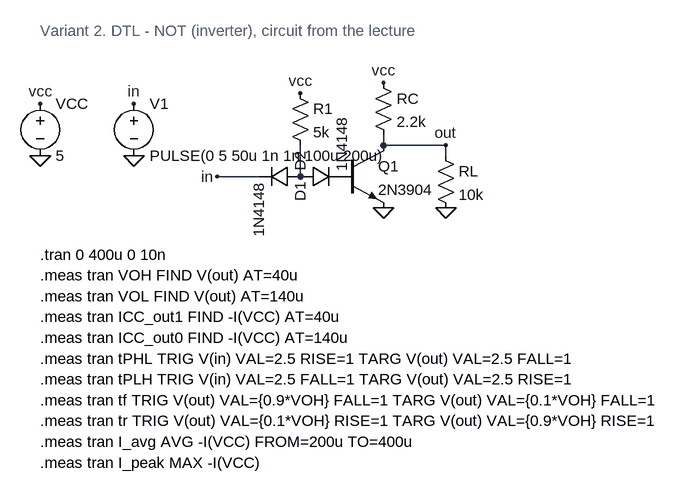
[diagram p0: schematic 1_DTL_NOT (1).asc]
1_DTL_NOT (1).asc, the LTspice schematic file:
Version 4
SHEET 1 1200 680
SYMBOL voltage -176 32 R0
SYMATTR InstName VCC
SYMATTR Value 5
FLAG -176 48 vcc
FLAG -176 128 0
SYMBOL voltage -32 32 R0
SYMATTR InstName V1
SYMATTR Value PULSE(0 5 50u 1n 1n 100u 200u)
FLAG -32 48 in
FLAG -32 128 0
SYMBOL res 208 16 R0
SYMATTR InstName R1
SYMATTR Value 5k
FLAG 224 32 vcc
WIRE 224 112 224 160
SYMBOL diode 224 144 R90
SYMATTR InstName D1
SYMATTR Value 1N4148
WIRE 160 160 96 160
FLAG 96 160 in
SYMBOL diode 224 176 R270
SYMATTR InstName D2
SYMATTR Value 1N4148
SYMBOL npn 288 112 R0
SYMATTR InstName Q1
SYMATTR Value 2N3904
FLAG 352 208 0
SYMBOL res 336 0 R0
SYMATTR InstName RC
SYMATTR Value 2.2k
FLAG 352 16 vcc
WIRE 352 96 352 112
WIRE 352 112 448 112
FLAG 448 112 out
SYMBOL res 432 112 R0
SYMATTR InstName RL
SYMATTR Value 10k
WIRE 448 112 448 128
FLAG 448 208 0
TEXT -176 280 Left 2 !.tran 0 400u 0 10n
TEXT -176 312 Left 2 !.meas tran VOH FIND V(out) AT=40u
TEXT -176 344 Left 2 !.meas tran VOL FIND V(out) AT=140u
TEXT -176 376 Left 2 !.meas tran ICC_out1 FIND -I(VCC) AT=40u
TEXT -176 408 Left 2 !.meas tran ICC_out0 FIND -I(VCC) AT=140u
TEXT -176 440 Left 2 !.meas tran tPHL TRIG V(in) VAL=2.5 RISE=1 TARG V(out) VAL=2.5 FALL=1
TEXT -176 472 Left 2 !.meas tran tPLH TRIG V(in) VAL=2.5 FALL=1 TARG V(out) VAL=2.5 RISE=1
TEXT -176 504 Left 2 !.meas tran tf TRIG V(out) VAL={0.9*VOH} FALL=1 TARG V(out) VAL={0.1*VOH} FALL=1
TEXT -176 536 Left 2 !.meas tran tr TRIG V(out) VAL={0.1*VOH} RISE=1 TARG V(out) VAL={0.9*VOH} RISE=1
TEXT -176 568 Left 2 !.meas tran I_avg AVG -I(VCC) FROM=200u TO=400u
TEXT -176 600 Left 2 !.meas tran I_peak MAX -I(VCC)
TEXT -176 -64 Left 2 ;Variant 2. DTL - NOT (inverter), circuit from the lecture

The netlist it stands for:
* 1_DTL_NOT (1).asc
VCC vcc 0 5
V1 in 0 PULSE(0 5 50u 1n 1n 100u 200u)
R1 vcc N001 5k
D1 N001 in 1N4148
D2 N001 P001 1N4148
Q1 out P001 0 0 2N3904
RC vcc out 2.2k
RL out 0 10k
.model D D
.lib standard.dio
.model NPN NPN
.model PNP PNP
.lib standard.bjt
.tran 0 400u 0 10n
.meas tran VOH FIND V(out) AT=40u
.meas tran VOL FIND V(out) AT=140u
.meas tran ICC_out1 FIND -I(VCC) AT=40u
.meas tran ICC_out0 FIND -I(VCC) AT=140u
.meas tran tPHL TRIG V(in) VAL=2.5 RISE=1 TARG V(out) VAL=2.5 FALL=1
.meas tran tPLH TRIG V(in) VAL=2.5 FALL=1 TARG V(out) VAL=2.5 RISE=1
.meas tran tf TRIG V(out) VAL={0.9*VOH} FALL=1 TARG V(out) VAL={0.1*VOH} FALL=1
.meas tran tr TRIG V(out) VAL={0.1*VOH} RISE=1 TARG V(out) VAL={0.9*VOH} RISE=1
.meas tran I_avg AVG -I(VCC) FROM=200u TO=400u
.meas tran I_peak MAX -I(VCC)
* Variant 2. DTL - NOT (inverter), circuit from the lecture
.backanno
.end